# Altium schematic sheet Main_Cont.SchDoc
size A4; DocumentNumber: 15; SheetNumber: 15; SheetTotal: 28
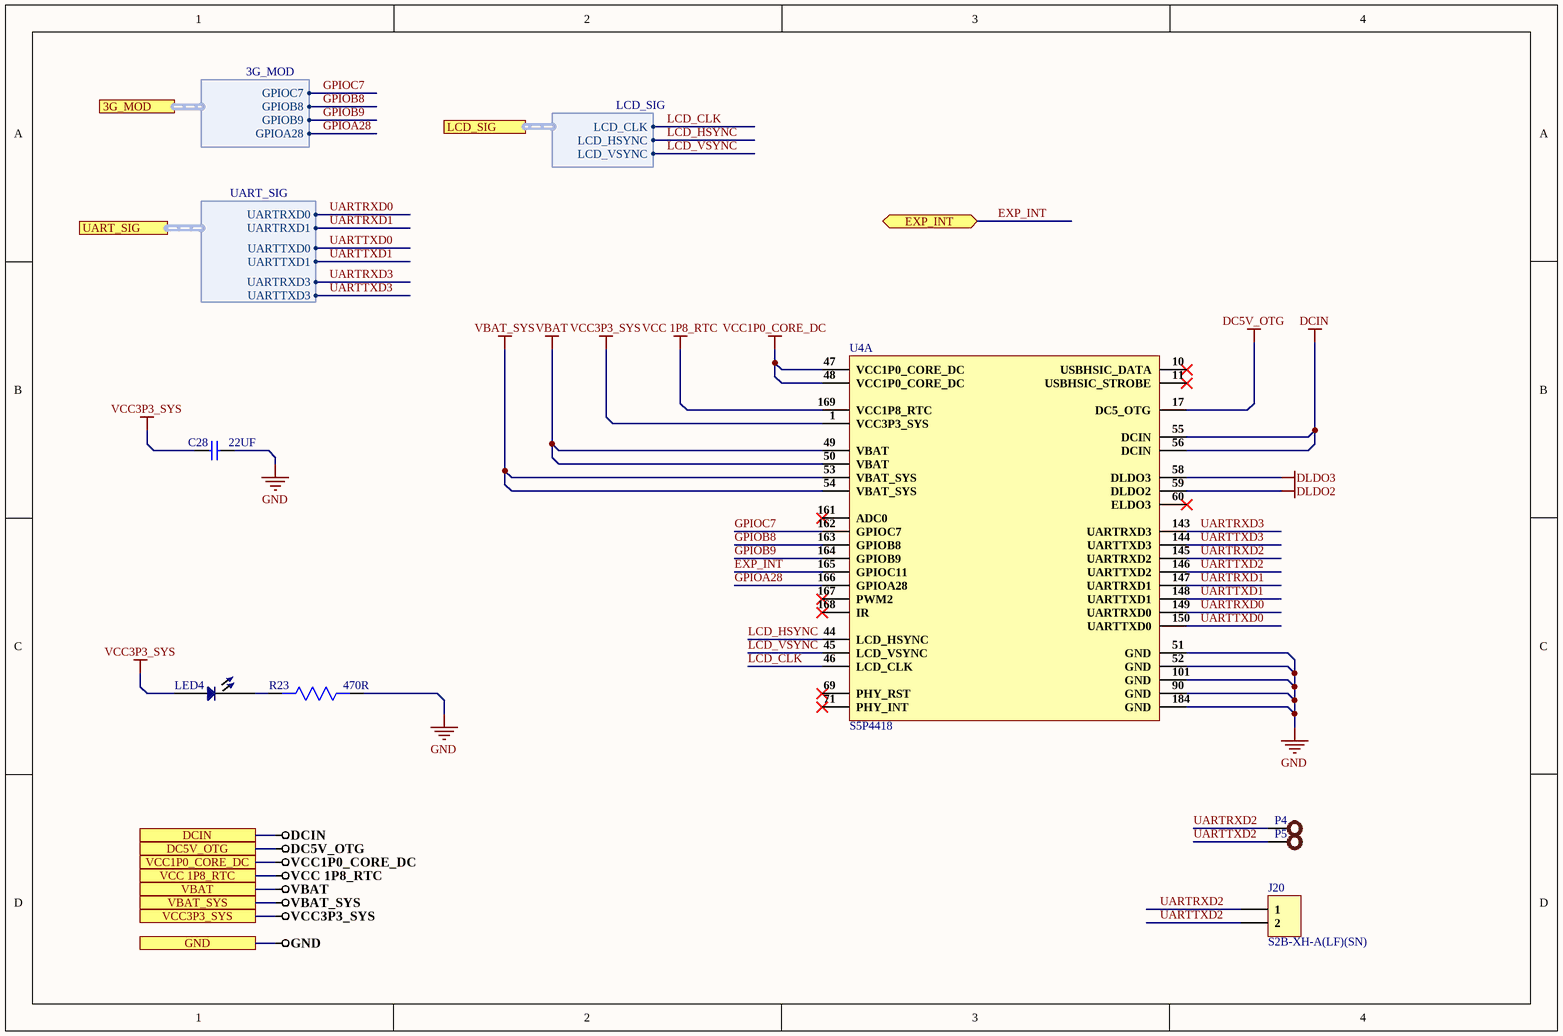
[diagram p0: Main_Cont.SchDoc]

## Parts
C28  22UF  [Cap0805]
J20  S2B-XH-A(LF)(SN)  [S2B-XH-A(LF)(SN)]
LED4  LED Blue  [LED 0402]  (value not drawn)
P4  Test Point  [TEST POINT]  (value not drawn)
P5  Test Point  [TEST POINT]  (value not drawn)
R23  470R  [Res0603]
U4  S5P4418  [S5P4418]  (part A of 6)

## Ports
3G_MOD (harness 3G_MOD), DC5V_OTG, DCIN, EXP_INT (bidir), GND, LCD_SIG (harness LCD_SIG), UART_SIG (harness UART_SIG), VBAT, VBAT_SYS, VCC1P0_CORE_DC, VCC3P3_SYS, VCC 1P8_RTC

## Harnesses
UART_SIG: UARTRXD0, UARTRXD1, UARTTXD0, UARTTXD1, UARTRXD3, UARTTXD3
LCD_SIG: LCD_CLK, LCD_HSYNC, LCD_VSYNC
3G_MOD: GPIOC7, GPIOB8, GPIOB9, GPIOA28

## Nets
DC5V_OTG: U4.17(DC5_OTG) ; port DC5V_OTG
DCIN: U4.55(DCIN) U4.56(DCIN) ; port DCIN
DLDO2: U4.59(DLDO2)
DLDO3: U4.58(DLDO3)
GND: C28.2 R23.1 U4.51(GND) U4.52(GND) U4.90(GND) U4.101(GND) U4.184(GND) ; port GND
VBAT: U4.49(VBAT) U4.50(VBAT) ; port VBAT
VBAT_SYS: U4.53(VBAT_SYS) U4.54(VBAT_SYS) ; port VBAT_SYS
VCC1P0_CORE_DC: U4.47(VCC1P0_CORE_DC) U4.48(VCC1P0_CORE_DC) ; port VCC1P0_CORE_DC
VCC3P3_SYS: C28.1 LED4.1 U4.1(VCC3P3_SYS) ; port VCC3P3_SYS
VCC 1P8_RTC: U4.169(VCC1P8_RTC) ; port VCC 1P8_RTC
EXP_INT: U4.165(GPIOC11) ; port EXP_INT
GPIOA28: U4.166(GPIOA28) ; port 3G_MOD.GPIOA28
GPIOB8: U4.163(GPIOB8) ; port 3G_MOD.GPIOB8
GPIOB9: U4.164(GPIOB9) ; port 3G_MOD.GPIOB9
GPIOC7: U4.162(GPIOC7) ; port 3G_MOD.GPIOC7
LCD_CLK: U4.46(LCD_CLK) ; port LCD_SIG.LCD_CLK
LCD_HSYNC: U4.44(LCD_HSYNC) ; port LCD_SIG.LCD_HSYNC
LCD_VSYNC: U4.45(LCD_VSYNC) ; port LCD_SIG.LCD_VSYNC
UARTRXD0: U4.149(UARTRXD0) ; port UART_SIG.UARTRXD0
UARTRXD1: U4.147(UARTRXD1) ; port UART_SIG.UARTRXD1
UARTRXD2: J20.1 P4.1 U4.145(UARTRXD2)
UARTRXD3: U4.143(UARTRXD3) ; port UART_SIG.UARTRXD3
UARTTXD0: U4.150(UARTTXD0) ; port UART_SIG.UARTTXD0
UARTTXD1: U4.148(UARTTXD1) ; port UART_SIG.UARTTXD1
UARTTXD2: J20.2 P5.1 U4.146(UARTTXD2)
UARTTXD3: U4.144(UARTTXD3) ; port UART_SIG.UARTTXD3
NetLED4_2: LED4.2 R23.2

Not connected (* = marked no-connect by the designer): U4 10(USBHSIC_DATA)* 11(USBHSIC_STROBE)* 60(ELDO3)* 69(PHY_RST)* 71(PHY_INT)* 161(ADC0)* 167(PWM2)* 168(IR)*

## Library data of the parts
C28 = C2012X5R1E226M125AC: CAP CER 22UF 25V X5R 0805
J20 = S2B-XH-A(LF)(SN): CONN HEADER R/A 2POS 2.5MM; Manufacturer: JST; Current Rating: 3A; Contact Resistance: 20mR; Voltage Rating (AC): 250V; Number of Positions: 2; Insulation Resistance: 1GR; Gender: Male; Connector Type: Male Pin; Wire/Cable Gauge: 22AWG; Supplier 1: Digi-Key; Manufacturer Part Number: S2B-XH-A(LF)(SN); RoHS: Yes; Category: Headers and Wire Housings; Stock 1: 44898; Pricing 1: 1=0.17000, 10=0.16200, 100=0.11260, 500=0.09524, 1000=0.07792, 5000=0.06927, 10000=0.06277 (USD); Mount: Through Hole; Contact Material: Brass; Contact Plating: Tin,Copper,Lead; Color: Natural; Housing Color: White; Housing Material: Polyamide; Min Operating Temperature: -25°C; Max Operating Temperature: 85°C; Number of Rows: 1; Voltage Rating: 250V; Termination: Press-Fit; Number of Contacts: 2; Max Current Rating: 3A; Package Quantity: 1000; Packaging: Bulk; Max Voltage Rating (AC): 250V; Max Voltage Rating (DC): 250V; Orientation: Right Angle; Length: 7.4mm; Pitch: 2.5mm; Lead Pitch: 2.5mm; Depth: 11.5mm; REACH SVHC: No SVHC; Lead Free: Lead Free; ComponentLink1URL: https://datasheet.ciiva.com/16208/s2b-xh-alfsn-16208978.pdf?src-supplier=Future+Electronics; ComponentLink1Description: https://datasheet.ciiva.com/16208/s2b-xh-alfsn-16208978.pdf?src-supplier=Future+Electronics; ComponentLink2URL: https://datasheet.ciiva.com/8052/1684882-8052211.pdf?src-supplier=Element14; ComponentLink2Description: https://datasheet.ciiva.com/8052/1684882-8052211.pdf?src-supplier=Element14; ComponentLink3URL: https://datasheet.ciiva.com/11746/0900766b8082f560-11746947.pdf?src-supplier=RSComponents; ComponentLink3Description: https://datasheet.ciiva.com/11746/0900766b8082f560-11746947.pdf?src-supplier=RSComponents; ComponentLink4URL: https://datasheet.ciiva.com/26894/getdatasheetpartid-640270-26894603.pdf?src-supplier=Verical; ComponentLink4Description: https://datasheet.ciiva.com/26894/getdatasheetpartid-640270-26894603.pdf?src-supplier=Verical; ComponentLink5URL: https://datasheet.ciiva.com/26924/getdatasheetpartid-645395-26924076.pdf?src-supplier=Verical; ComponentLink5Description: https://datasheet.ciiva.com/26924/getdatasheetpartid-645395-26924076.pdf?src-supplier=Verical; ComponentLink6URL: https://datasheet.ciiva.com/26894/getdatasheetpartid-441330-26894909.pdf?src-supplier=Verical; ComponentLink6Description: https://datasheet.ciiva.com/26894/getdatasheetpartid-441330-26894909.pdf?src-supplier=Verical; ComponentLink7URL: https://datasheet.ciiva.com/726/exh-726412.pdf?src-supplier=Digi-Key; ComponentLink7Description: https://datasheet.ciiva.com/726/exh-726412.pdf?src-supplier=Digi-Key; ComponentLink8URL: https://datasheet.ciiva.com/20207/523653-20207183.pdf?src-supplier=Rapid+Electronics; ComponentLink8Description: https://datasheet.ciiva.com/20207/523653-20207183.pdf?src-supplier=Rapid+Electronics; Supplier Part Number 1: 455-2257-ND
LED4 = APHHS1005QBC/D: LED BLUE CLEAR CHIP SMD 0402; Manufacturer: Kingbright; Lens Colour: Colorless; Forward Current: 20mA; Forward Voltage: 3.3V; Power Rating: 120mW; Luminous Intensity: 60mcd; Viewing Angle: 120°; Dominant Wavelength: 465nm; Supplier 1: Digi-Key; Manufacturer Part Number: APHHS1005QBC/D; Stock 1: 57149; Pricing 1: 1=0.58, 10=0.42, 25=0.3432, 100=0.2746, 250=0.23168, 500=0.19734, 1000=0.15444 (USD); Mount: Surface Mount; Case/Package: 0402; Colour: Blue; Case Code (Metric): 1005; Case Code (Imperial): 0402; Min Operating Temperature: -40°C; Max Operating Temperature: 85°C; Package Quantity: 2000; Illumination Colour: Blue; Packaging: Tape and Reel; Lens Style: Clear; Lens Transparency: Clear; Test Current: 20mA; Length: 1mm; Height: 0.6mm; Width: 0.5mm; Lead Free: Lead Free; ComponentLink1URL: http://www.mouser.com/ds/2/216/APHHS1005QBC-D-54846.pdf; ComponentLink1Description: http://www.mouser.com/ds/2/216/APHHS1005QBC-D-54846.pdf; ComponentLink2URL: http://www.kingbrightusa.com/images/catalog/SPEC/APHHS1005QBC-D.pdf; ComponentLink2Description: http://www.kingbrightusa.com/images/catalog/SPEC/APHHS1005QBC-D.pdf; Supplier Part Number 1: 754-1504-1-ND
P4 P5 = TEST POINT: Test Point ON
R23 = RC0603FR-07470RL: RES SMD 470 OHM 1% 1/10W 0603; Manufacturer: Yageo; Power Rating: 100mW; Voltage Rating: 50V; Temperature Coefficient: 100ppm/°C; Working Voltage: 75V; Supplier 1: Digi-Key; Manufacturer Part Number: RC0603FR-07470RL; Stock 1: 4530601; Pricing 1: 1=0.1, 10=0.023, 100=0.0094, 1000=0.00421, 2500=0.00366 (USD); Case/Package: 0603; Case Code (Metric): 1608; Case Code (Imperial): 0603; Min Operating Temperature: -55°C; Max Operating Temperature: 155°C; Tolerance: 1%; Resistance: 470R; Packaging: Tape and Reel; Package Quantity: 1; Composition: Thick Film; Number of Terminations: 2; Termination: SMD/SMT; Military Standard: Not; Max Power Dissipation: 100mW; Features: Moisture Resistant; Length: 1.6mm; Height: 0.022inch; Width: 0.031inch; Depth: 0.8mm; REACH SVHC: No SVHC; Lead Free: Lead Free; ComponentLink1URL: http://documents.rs-components.com/techlib://itc_doclist_GB.htm?stockno=5047341&src-supplier=RSComponents; ComponentLink1Description: http://documents.rs-components.com/techlib://itc_doclist_GB.htm?stockno=5047341&src-supplier=RSComponents; ComponentLink2URL: http://www.farnell.com/datasheets/1868787.pdf?src-supplier=Element14; ComponentLink2Description: http://www.farnell.com/datasheets/1868787.pdf?src-supplier=Element14; ComponentLink3URL: http://www.farnell.com/datasheets/2167052.pdf?src-supplier=Element14; ComponentLink3Description: http://www.farnell.com/datasheets/2167052.pdf?src-supplier=Element14; ComponentLink4URL: http://www.yageo.com/documents/recent/PYu-RC_Group_51_RoHS_L_10.pdf?src-supplier=Digi-Key; ComponentLink4Description: http://www.yageo.com/documents/recent/PYu-RC_Group_51_RoHS_L_10.pdf?src-supplier=Digi-Key; Supplier Part Number 1: 311-470HRCT-ND
U4 = S5P4418: S5P4418 Quad Core Android SoM System on Module; Manufacturer: Samsung; Value: Custom; Manufacturer Part No: S5P4418; Package: Custom